# EasyEDA Pro project curtain-lifter.epro, board PCB1
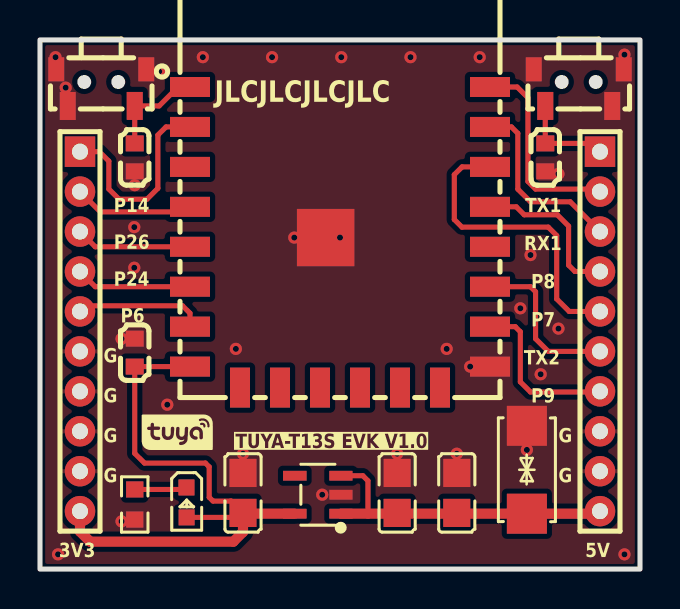
[diagram p10: board, top side]
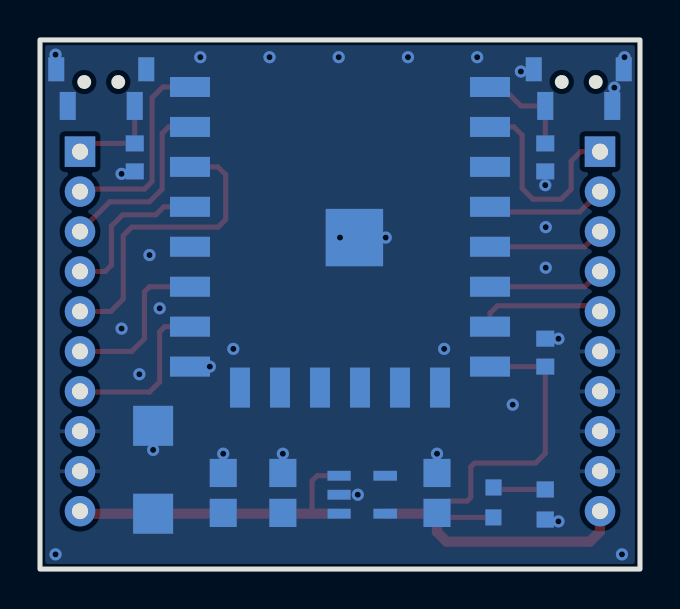
[diagram p11: board, bottom side, seen from below]

Outline 30 x 26.49 mm; copper layers: Top Layer, Bottom Layer. Coordinates in mm from the lower left corner of the outline.
Outline path: rectangle 0,26.49 30,0
Stack: Top Layer 0.035mm / Dielectric1 1.51mm FR4 er 4.5 / Bottom Layer 0.035mm

## Design rules (mm)
spacing copperThickness1oz (default): track to track 0.102, other pairs 0.152 to 0.3
spacing copperThickness2oz: track to track 0.203, other pairs 0.152 to 0.3
track width copperThickness1oz (default): min 0.127, default 0.254, max 2.54
track width copperThickness2oz: min 0.203, default 0.254, max 2.54
differential pair differentialPair (default): width min 0.127, default 0.254, max 2.54; gap min 0.152, default 0.152

## Placement (name value [footprint] x y rotation side)
C1  10uF  [C0805]  10.15 3.81 270 top
C2  10uF  [C0805]  20.84 3.81 270 top
C3  10uF  [C0805]  17.86 3.81 90 top
C4  100nF  [C0603]  4.74 10.84 270 top
C5  100nF  [C0603]  4.74 20.61 270 top
C6  100nF  [C0603]  25.26 20.61 270 top
D1  SMAJ5.0CA  [SMA_L4.3-W2.6-LS5.0-BI]  24.34 4.97 270 top
H3  HX PZ2.0-1x10P ZZ  [HDR-TH_10P-P2.00-V-M-1]  2 11.9 270 top
H4  HX PZ2.0-1x10P ZZ  [HDR-TH_10P-P2.00-V-M-1]  28 11.9 270 top
LED1  XL-1608SURC-06  [LED0603-RD_RED]  7.33 3.34 270 top
R1  2kΩ  [R0603]  4.74 3.23 270 top
SW1  TS24CA 250gf 013  [SW-SMD_L4.7-W3.5-P3.35-EH]  26.94 24.1 0 top
SW2  TS24CA 250gf 013  [SW-SMD_L4.7-W3.5-P3.35-EH]  3.06 24.1 0 top
U2  CB3S(qh6)  [WIFIM-SMD_TUYA_CB3S]  15 16.61 0 top
U3  SPX3819M5-L-3-3/TR  [SOT-23-5_L3.0-W1.7-P0.95-LS2.8-BL]  13.89 3.72 90 top

## Footprints (pads in the part's own frame, mm; a bottom-side part is the same pattern mirrored in y, then rotated)
C0603
  rect 0.8x0.9 hole 0.001: 1(-0.7,0) 2(0.7,0)
C0805
  rect 1.41x1.35 hole 0.001: 1(-1,0) 2(1,0)
HDR-TH_10P-P2.00-V-M-1
  rect 1.524x1.524 hole 0.8: 1(-9,0)
  round 1.524 hole 0.8: 2(-7,0) 3(-5,0) 4(-3,0) 5(-1,0) 6(1,0) 7(3,0) 8(5,0) 9(7,0) 10(9,0)
LED0603-RD_RED
  rect 0.8x0.8 hole 0.001: 1(-0.749,-0.004) 2(0.749,0.004)
R0603
  rect 0.806x0.864 hole 0.001: 1(-0.753,0) 2(0.753,0)
SMA_L4.3-W2.6-LS5.0-BI
  rect 2x2 hole 0.001: 1(-2.2,0) 2(2.2,0)
SOT-23-5_L3.0-W1.7-P0.95-LS2.8-BL
  rect 0.49x1.157 hole 0.001: 1(-0.95,-1.153) 2(0,-1.153) 3(0.95,-1.153)
  rect 0.49x1.175 hole 0.001: 4(0.95,1.153) 5(-0.95,1.153)
SW-SMD_L4.7-W3.5-P3.35-EH
  rect 0.8x1.4 hole 0.001: 1(-1.675,-0.917) 2(1.675,-0.917)
  rect 0.8x1.2 hole 0.001: 3(-2.25,0.917) 4(2.25,0.917)
WIFIM-SMD_TUYA_CB3S
  rect 2x1 hole 0.001: 1(-7.5,7.525) 2(-7.5,5.525) 3(-7.5,3.525) 4(-7.5,1.525) 5(-7.5,-0.475) 6(-7.5,-2.475) 7(-7.5,-4.475) 8(-7.5,-6.475) 9(7.5,-6.475) 10(7.5,-4.475) 11(7.5,-2.475) 12(7.5,-0.475) 13(7.5,1.525) 14(7.5,3.525) 15(7.5,5.525) 16(7.5,7.525)
  rect 1x2 hole 0.001: 17(-5,-7.525) 18(-3,-7.525) 19(-1,-7.525) 20(1,-7.525) 21(3,-7.525) 22(5,-7.525)
  rect 2.87x2.87 hole 0.001: 23(-0.72,-0.015)

## Nets
As in the schematic.

Pads without a net: U2 3 12 17 18 19 20 21 22; U3 4

## Via types
v1: diameter 0.61, hole 0.305, Top Layer to Bottom Layer, 32 vias

## Routing (per net, layer and track width the routed paths; a pad name or vN(x,y) marks a point on that pad's centre or on a via; arc(x,y) is an arc through that point)
3.3V: length 30.7
  Top Layer w0.254: 10.19,2.77 C1.2 ; C1.2 9.93,2.59 LED1.2 ; C1.2 9.56,3.4 8.65,3.4 8.46,3.59 8.46,5.12 8.27,5.31 5.22,5.31 4.74,5.79 C4.2 7.5,10.14
  Top Layer w0.508: U3.5 10.19,2.77 ; C1.2 10.15,1.86 9.67,1.37 2.51,1.37 2,1.88 H3.10
5V: length 16.1
  Top Layer w0.254: 15.05,4.67 16.14,4.67 16.4,4.42 16.4,2.77 ; 27.87,2.77 H4.10
  Top Layer w0.508: D1.2 27.87,2.77 ; 15.05,2.77 24.34,2.77
GND:
  vias: v1(0.78,25.63) v1(0.9,0.74) v1(1.28,24.1) v1(4.08,11.53) v1(4.08,2.39) v1(4.74,19.22) v1(4.71,17.12) v1(4.71,15.09) v1(5.96,24.91) v1(6.36,8.23) v1(8.14,25.63) v1(9.79,11.02) v1(10.15,5.77) v1(11.6,25.63) v1(12.71,16.6) v1(14.11,3.72) v1(15,16.6) v1(15.06,25.63) v1(17.86,5.77) v1(18.52,25.63) v1(20.33,11.02) v1(20.84,5.77) v1(21.51,10.14) v1(21.99,25.63) v1(24.02,13.05) v1(24.34,5.97) v1(24.53,15.72) v1(25.03,9.75) v1(25.92,19.79) v1(25.92,12.04) v1(29.22,25.75) v1(29.22,0.74)
ADC3: length 10.4
  Top Layer w0.254: H3.1 2.97,20.9 3.44,20.42 3.44,19.02 3.95,18.52 5.35,18.52 5.89,19.06 5.89,21.73 6.3,22.14 7.5,22.14
BTN: length 4.8
  Top Layer w0.254: 25.26,23.19 C6.1 27.59,21.31 H4.1
NRST: length 5
  Top Layer w0.254: C5.1 4.74,23.19 5.95,23.19 6.9,24.14 7.5,24.14
P6: length 6.4
  Top Layer w0.254: 7.5,12.14 7.5,12.81 7.13,13.18 2.28,13.18 H3.5
P7: length 15.2
  Top Layer w0.254: 22.5,20.14 21.1,20.14 20.72,19.75 20.72,17.5 21.1,17.12 25.41,17.12 25.84,16.7 25.84,13.52 26.46,12.9 H4.5
P8: length 8
  Top Layer w0.254: H4.4 26.75,14.9 26.43,15.21 26.43,17.17 25.86,17.74 24.21,17.74 23.81,18.14 22.5,18.14
P9: length 8.3
  Top Layer w0.254: H4.7 27.97,8.86 24.53,8.86 24.02,9.37 24.02,11.88 23.76,12.14 22.5,12.14
P14: length 6
  Top Layer w0.254: H3.2 3.02,17.88 7.25,17.88 7.5,18.14
P24: length 5.8
  Top Layer w0.254: H3.4 2.76,14.14 7.5,14.14
P26: length 5.8
  Top Layer w0.254: H3.3 2.76,16.14 7.5,16.14
RXD1: length 9.3
  Top Layer w0.254: H4.3 26.51,18.39 24.53,18.39 23.89,19.02 23.89,21.82 23.57,22.14 22.5,22.14
TXD1: length 10.1
  Top Layer w0.254: H4.2 27.87,19.02 24.78,19.02 24.4,19.41 24.4,23.6 23.86,24.14 22.5,24.14
TXD2: length 8.2
  Top Layer w0.254: H4.6 25.41,10.9 24.78,11.53 24.78,13.88 24.53,14.14 22.5,14.14
$1N62: length 2.6
  Top Layer w0.254: LED1.1 7.22,3.99 4.74,3.99

## Copper pours and planes (outline as drawn; the poured copper is in the pictures)
GND on Top Layer: 0,26.49 30,26.49 30,0 0,0
GND on Bottom Layer: 0,26.49 30,26.49 30,0 0,0

## Text on the board
Top Silkscreen Layer: 3V3 | G | P14 | P24 | P26 | P6 | TUYA-T13S EVK V1.0 | TX2 | RX1 | TX1 | P8 | P7 | P9 | 5V | JLCJLCJLCJLC
